# EasyEDA schematic SCH_Thingyyyy_2026-10-10.EasyEDA.json
TITLE: Sheet_1; REV: 1.0; Date: 2026-10-05; Sheet: 1/1; Drawn By: orangeoctopus01; Company: Your Company
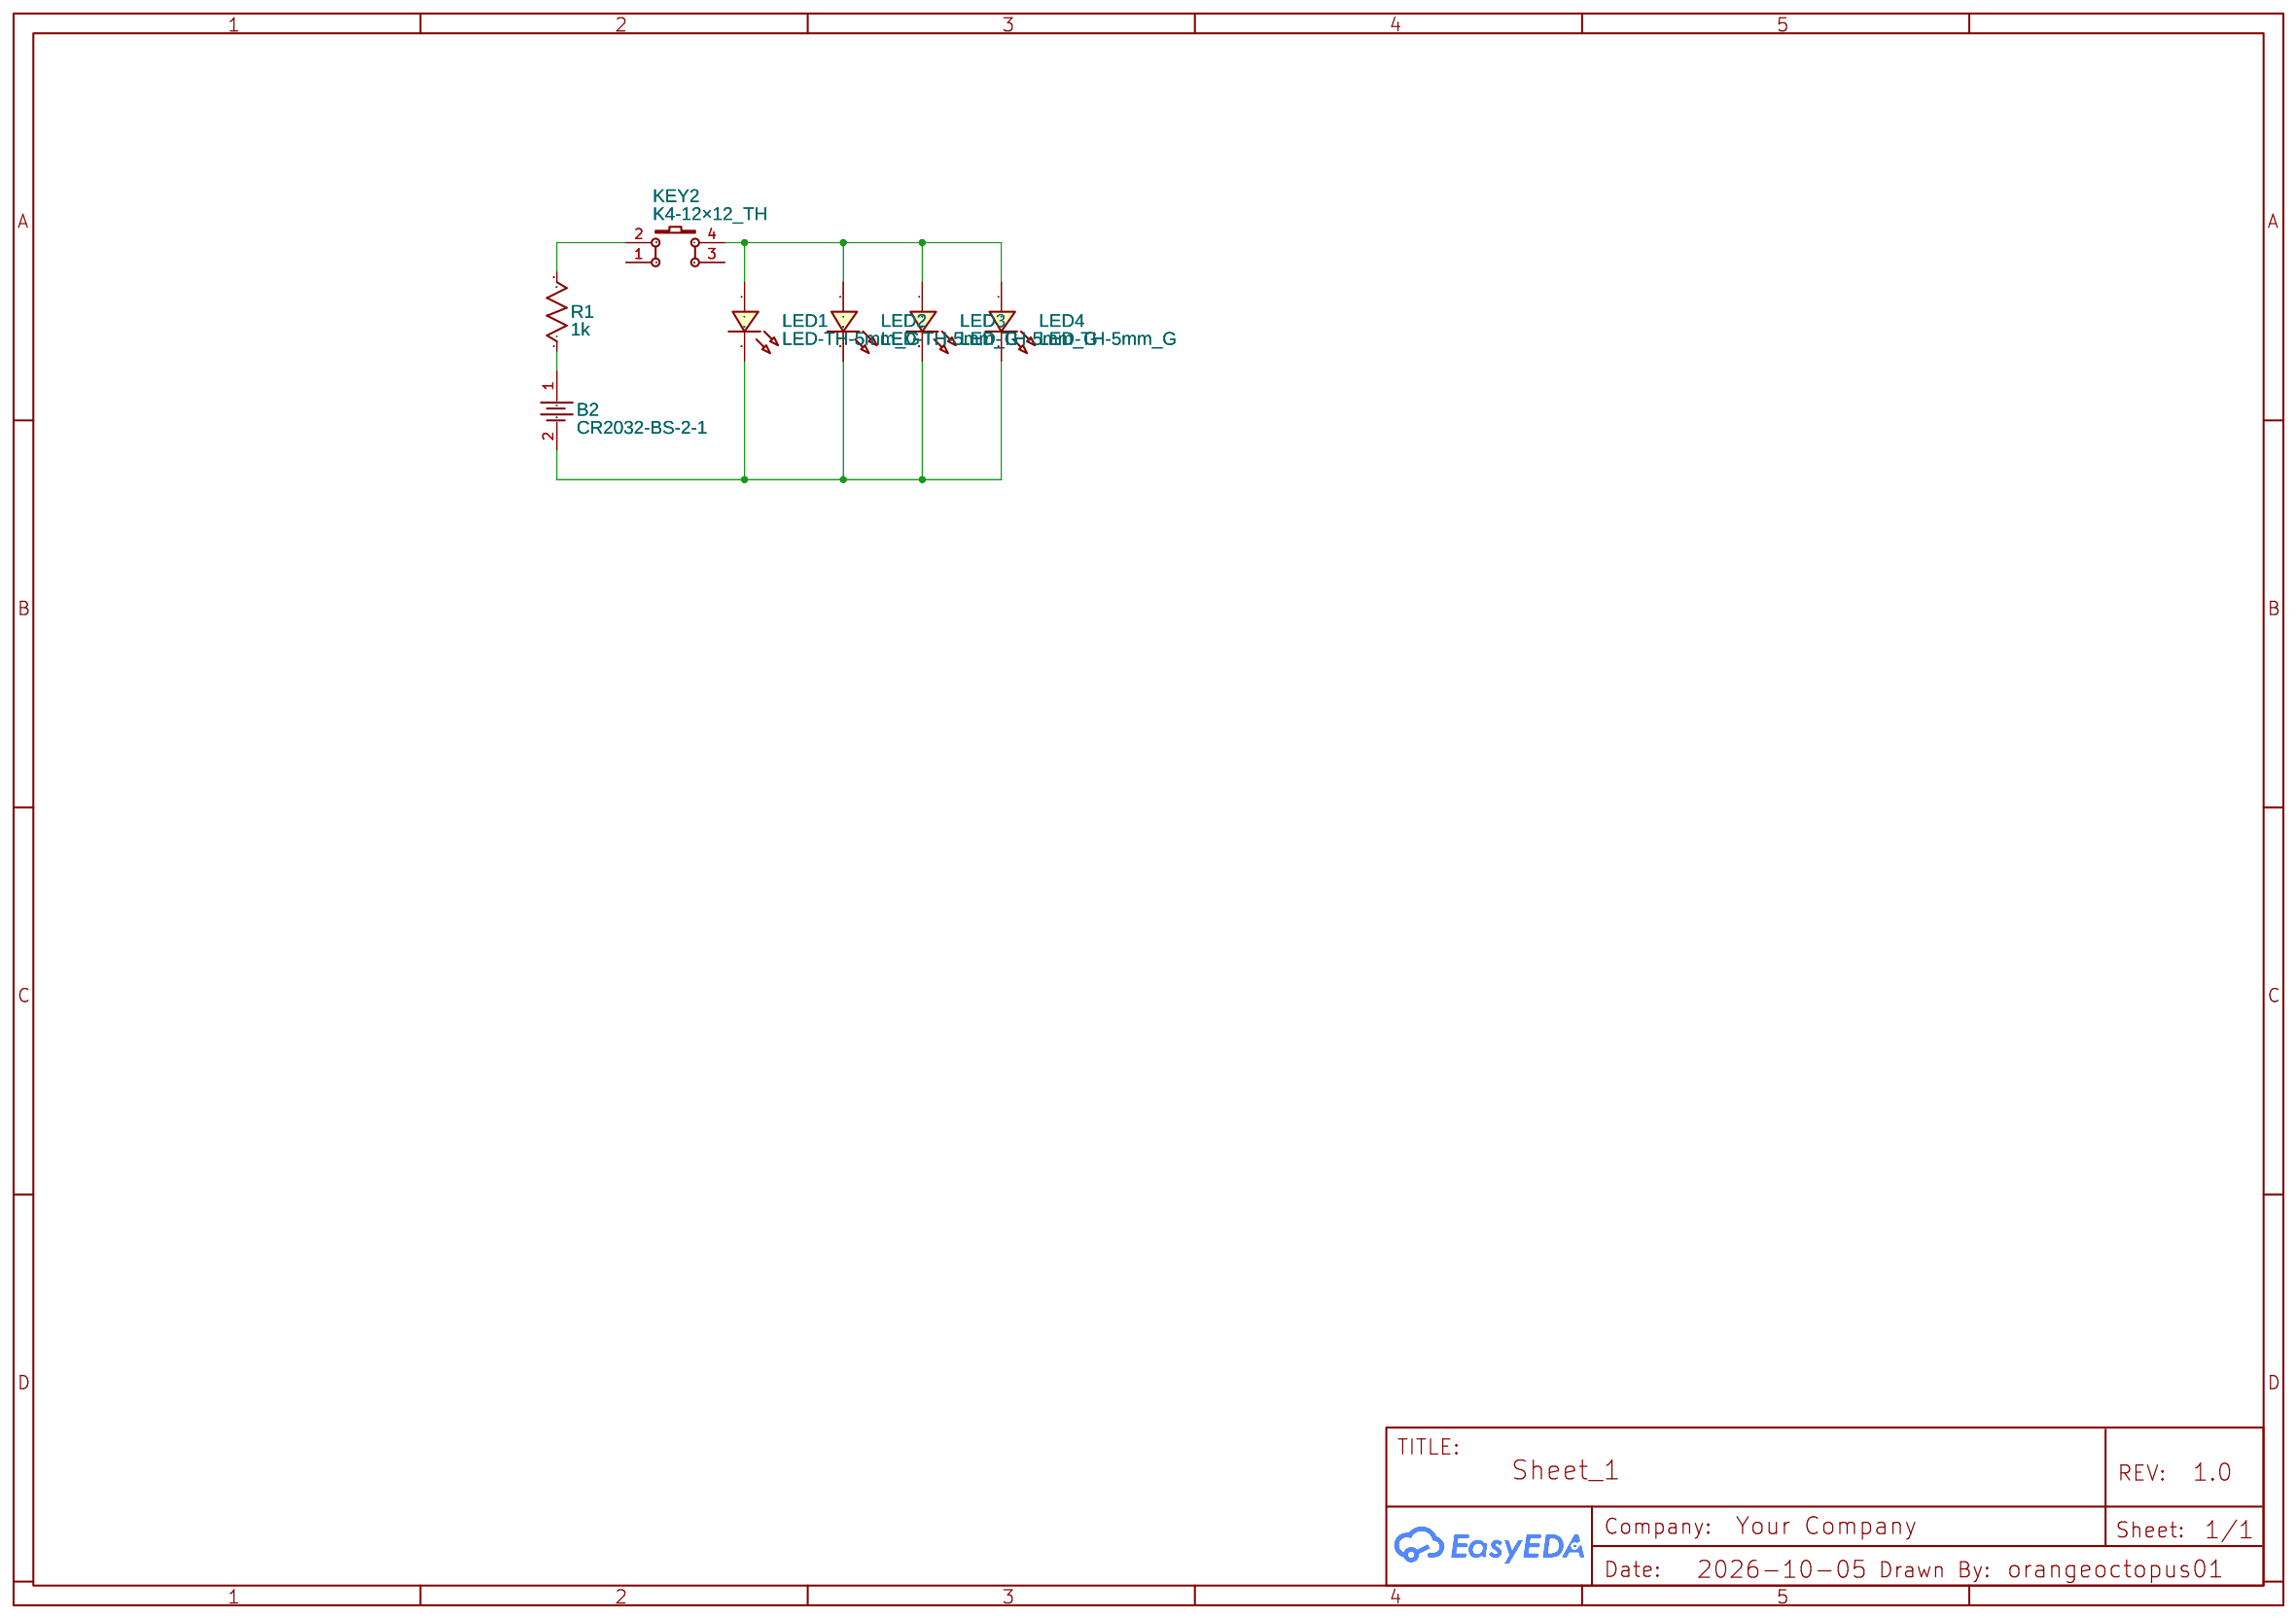
[diagram p0: schematic sheet]

## Parts
B2  CR2032-BS-2-1  [BAT-TH_BS-2-1]
KEY2  K4-12×12_TH  [KEY-TH_4P-L12.0-W12.0-P5.00-LS12.5]
LED1  LED-TH-5mm_G  [LED-TH_BD5.0_GREEN]
LED2  LED-TH-5mm_G  [LED-TH_BD5.0_GREEN]
LED3  LED-TH-5mm_G  [LED-TH_BD5.0_GREEN]
LED4  LED-TH-5mm_G  [LED-TH_BD5.0_GREEN]
R1  1k  [R_AXIAL-0.6]

## Library data of the parts
B2 = CR2032-BS-2-1: Supplier: LCSC; Manufacturer: Q&J; Manufacturer Part: BS-2-1; image: //image.lceda.cn/szlcsc/C70376.jpg; Supplier Part: C70376
KEY2 = K4-12×12_TH: Supplier Part: C128053; Supplier: LCSC; Manufacturer: 韩国韩荣; Manufacturer Part: K2-1103DP-M4SW-04; Contributor: LCEDA_Lib
LED1-LED4 = LED-TH-5mm_G: Manufacturer: EVERLIGHT(台湾亿光); Manufacturer Part: 333-2SYGD/S530-E2; Supplier Part: C88163; Supplier: LCSC; Contributor: LCEDA_Lib
R1 = R_AXIAL-0.6_US: Contributor: LCEDA_Lib

## Nets
Net-(B2-1): B2.1 R1.1
Net-(B2-2): B2.2 LED1.2 LED2.2 LED3.2 LED4.2
Net-(KEY2-2): KEY2.2 R1.2
Net-(KEY2-4): KEY2.4 LED1.1 LED2.1 LED3.1 LED4.1

Not connected (* = marked no-connect by the designer): KEY2 1 3
